# Altium project BACK.PrjPcb
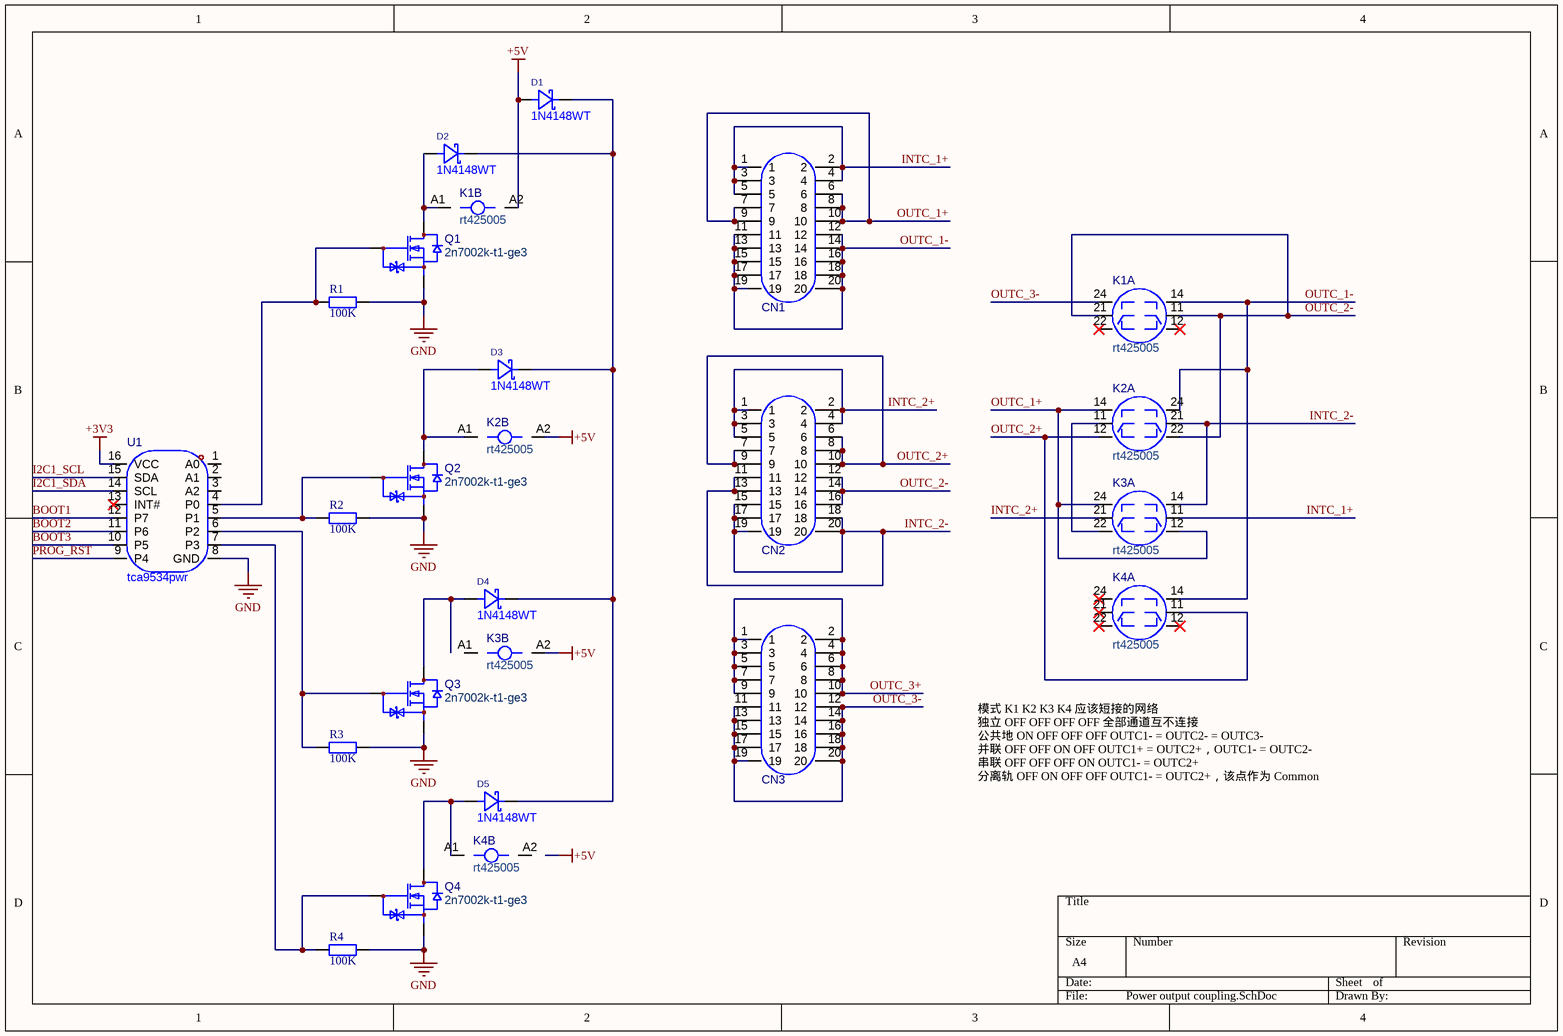
[diagram p0: Power output coupling.SchDoc]
2 sheets, 26 parts. Net scope: global (net labels, ports and power ports of the same name join across sheets).
Sheets:
  Power output coupling.SchDoc
  DIB_connect.SchDoc

## Sheet Power output coupling.SchDoc
size A4; SheetNumber: 1; SheetTotal: 2

### Parts
CN1  sbh11-pbpc-d10-st-bk  [IDC-TH_20P-P2.54-V-R2-C10-S2.54]  (value not drawn)
CN2  sbh11-pbpc-d10-st-bk  [IDC-TH_20P-P2.54-V-R2-C10-S2.54]  (value not drawn)
CN3  sbh11-pbpc-d10-st-bk  [IDC-TH_20P-P2.54-V-R2-C10-S2.54]  (value not drawn)
D1  1N4148WT  [SOD-523_L1.2-W0.8-LS1.6-FD]
D2  1N4148WT  [SOD-523_L1.2-W0.8-LS1.6-FD]
D3  1N4148WT  [SOD-523_L1.2-W0.8-LS1.6-FD]
D4  1N4148WT  [SOD-523_L1.2-W0.8-LS1.6-FD]
D5  1N4148WT  [SOD-523_L1.2-W0.8-LS1.6-FD]
K1  rt425005  [RELAY-TH_TE-CONNECTIVITY_RTX2XXX]  (parts A,B of 2)
K2  rt425005  [RELAY-TH_TE-CONNECTIVITY_RTX2XXX]  (parts A,B of 2)
K3  rt425005  [RELAY-TH_TE-CONNECTIVITY_RTX2XXX]  (parts A,B of 2)
K4  rt425005  [RELAY-TH_TE-CONNECTIVITY_RTX2XXX]  (parts A,B of 2)
Q1  2n7002k-t1-ge3  [SOT-23-3_L2.9-W1.6-P1.90-LS2.8-BR]
Q2  2n7002k-t1-ge3  [SOT-23-3_L2.9-W1.6-P1.90-LS2.8-BR]
Q3  2n7002k-t1-ge3  [SOT-23-3_L2.9-W1.6-P1.90-LS2.8-BR]
Q4  2n7002k-t1-ge3  [SOT-23-3_L2.9-W1.6-P1.90-LS2.8-BR]
R1  100K  [R0603]
R2  100K  [R0603]
R3  100K  [R0603]
R4  100K  [R0603]
U1  tca9534pwr  [TSSOP-16_L5.0-W4.4-P0.65-LS6.4-BL]

### Nets
+3V3: U1.16(VCC)
+5V: D1.1(A) K1.A2 K2.A2 K3.A2
GND: Q1.2(S) Q2.2(S) Q3.2(S) Q4.2(S) R1.2 R2.2 R3.2 R4.2 U1.8(GND)
BOOT1: U1.12(P7)
BOOT2: U1.11(P6)
BOOT3: U1.10(P5)
I2C1_SCL: U1.15(SDA)
I2C1_SDA: U1.14(SCL)
INTC_1+: CN1.1 CN1.2 CN1.3 CN1.4 CN1.5 K3.11
INTC_2+: CN2.1 CN2.2 CN2.3 CN2.4 CN2.5 K3.21
INTC_2-: CN2.11 CN2.13 CN2.15 CN2.17 CN2.18 CN2.19 CN2.20 K2.21 K3.14
OUTC_1+: CN1.6 CN1.7 CN1.8 CN1.9 CN1.10 K2.14 K3.12 K3.24
OUTC_1-: CN1.11 CN1.12 CN1.13 CN1.14 CN1.15 CN1.16 CN1.17 CN1.18 CN1.19 CN1.20 K1.14 K2.24 K4.14
OUTC_2+: CN2.6 CN2.7 CN2.8 CN2.9 CN2.10 K2.12 K4.11
OUTC_2-: CN2.12 CN2.14 CN2.16 K1.11 K1.21 K2.22
OUTC_3+: CN3.1 CN3.2 CN3.3 CN3.4 CN3.5 CN3.6 CN3.7 CN3.8 CN3.9 CN3.10
OUTC_3-: CN3.11 CN3.12 CN3.13 CN3.14 CN3.15 CN3.16 CN3.17 CN3.18 CN3.19 CN3.20 K1.24
PROG_RST: U1.9(P4)
NetD1_2: D1.2(K) D2.2(K) D3.2(K) D4.2(K) D5.2(K)
NetD2_1: D2.1(A) K1.A1 Q1.3(D)
NetD3_1: D3.1(A) K2.A1 Q2.3(D)
NetD4_1: D4.1(A) Q3.3(D)
NetD5_1: D5.1(A) K4.A1 Q4.3(D)
NetK2_11: K2.11 K3.22
NetQ1_1: Q1.1(G) R1.1 U1.4(P0)
NetQ2_1: Q2.1(G) R2.1 U1.5(P1)
NetQ3_1: Q3.1(G) R3.1 U1.6(P2)
NetQ4_1: Q4.1(G) R4.1 U1.7(P3)

Not connected (* = marked no-connect by the designer): K1 12* 22*; K3 A1; K4 12* 21* 22* 24* A2; U1 1(A0) 2(A1) 3(A2) 13(INT#)*

### Notes on the sheet
- 模式	K1	K2	K3	K4	应该短接的网络
  独立	OFF	OFF	OFF	OFF	全部通道互不连接
  公共地	ON	OFF	OFF	OFF	OUTC1- = OUTC2- = OUTC3-
  并联	OFF	OFF	ON	OFF	OUTC1+ = OUTC2+，OUTC1- = OUTC2-
  串联	OFF	OFF	OFF	ON	OUTC1- = OUTC2+
  分离轨	OFF	ON	OFF	OFF	OUTC1- = OUTC2+，该点作为 Common

### Library data of the parts
CN1-CN3 = sbh11-pbpc-d10-st-bk: 插针结构:2x10P;间距:2.54mm;安装方式:直插;总PIN数:20P;排数:2;每排PIN数:10;行距:2.54mm;额定电流:3A;触头材质:黄铜;触头镀层:金;工作温度:-40℃~+105℃;; Manufacturer: Sullins; AddInBom: yes; ModelId: 919cb9b113224b379d0081fecd8b0ef1; ModelTransform: 1299.21,358.267,0,0,0,0,0,5.906,-118.11; Pins Structure: 2x10P; Pitch: 2.54mm; Number of PINs Per Row: 10; Current Rating: 3A; Flame Retardant Rating: UL94V-0; Symbol: SBH11-PBPC-D10-ST-BK; LCSC Part Name: 2x10P 间距:2.54mm 直插; SupplierPart: C17537739; ManufacturerPart: SBH11-PBPC-D10-ST-BK; Supplier Footprint: 插件; JLCPCB Part Class: Extended Part; Datasheet: https://item.szlcsc.com/datasheet/SBH11-PBPC-D10-ST-BK/18666954.html; Supplier: LCSC; ConvertToPcb: yes; FootprintName: IDC-TH_20P-P2.54-V-R2-C10-S2.54; ModelName: IDC-TH_20P-P2.54-V-R2-C10-S2.54; Mounting Type: 直插; Number of Pins: 20P; Number of Rows: 2; Row Spacing: 2.54mm; Contact Material: 黄铜; Contact Plating: 金; Operating Temperature: -40℃~+105℃; Color: 黑色
D1-D5 = 1N4148WT: 二极管配置:独立式;整流电流:150mA;直流反向耐压(Vr):100V;正向压降(Vf):1.25V@150mA;反向恢复时间(Trr):4ns;; Manufacturer: R+O(宏嘉诚); Symbol: 1N4148WT_C7420320; AddInBom: yes; ModelId: 8f56a03db567494d8f4c9d12aa52a741; ModelName: SOD-523_L1.2-W0.8-H0.7-LS1.6; ModelTransform: 62.992,31.496,0,0,0,0,0,0,0; Diode Configuration: 独立式; Pd - Power Dissipation: 150mW; Current - Rectified: 150mA; Voltage - DC Reverse(Vr): 100V; Non-Repetitive Peak Forward Surge Current: 2A; Reverse Leakage Current (Ir): 1uA@75V; Reverse Recovery Time (trr): 4ns; Operating Junction Temperature Range: -55℃~+150℃; LCSC Part Name: 100V 150mA; SupplierPart: C7420320; ManufacturerPart: 1N4148WT; Supplier Footprint: SOD-523; JLCPCB Part Class: Extended Part; Datasheet: https://item.szlcsc.com/datasheet/1N4148WT/8397142.html; Supplier: LCSC; ConvertToPcb: yes; FootprintName: SOD-523_L1.2-W0.8-LS1.6-FD; Voltage - Forward(Vf@If): 1.25V@150mA
K1-K4 = rt425005: 线圈电压:5V;触点形式:两组转换:2C(双刀双掷-转换);触点容量(电阻负载):-;最大切换电压:400V@AC;最大切换电流:8A;; Manufacturer: TE Connectivity(泰科电子); AddInBom: yes; Coil Voltage: 5V; Switching Current(Max): 8A; Operate Time: 8ms; Release Time: 6ms; Symbol: RT425005; LCSC Part Name: 无锁存; SupplierPart: C1562806; ManufacturerPart: RT425005; Supplier Footprint: 插件,12.7x29mm; JLCPCB Part Class: Extended Part; Datasheet: https://atta.szlcsc.com/upload/public/pdf/source/20190115/C355428_EB073CA45DAF06C209EB42DB64E487D3.pdf; Supplier: LCSC; ConvertToPcb: yes; FootprintName: RELAY-TH_TE-CONNECTIVITY_RTX2XXX; Contact Form: 两组转换:2C(双刀双掷-转换); Number of Pins: -; Contact Rating: -; Switching Voltage(Max): 400V@AC; Contact Material: AgNi+镀金; Coil Type: -; Coil Resistance: -; Contact Resistance: -; Operating Temperature: -40℃~+85℃
Q1-Q4 = 2n7002k-t1-ge3: 数量:1个N沟道;漏源电压(Vdss):60V;连续漏极电流(Id):300mA;导通电阻(RDS(on)):2Ω@10V;耗散功率(Pd):350mW;阈值电压(Vgs(th)):2.5V;; Manufacturer: VISHAY(威世); AddInBom: yes; ModelId: 89cb27a44ab2466697082bb9fd73a7d0; ModelName: SOT-23-3L_L2.9-W1.6-H1.1-LS2.8-P0.95; ModelTransform: 114.173,110.236,0,90,0,0,0,0,0; Number: 1个N沟道; Drain to Source Voltage: 60V; Current - Continuous Drain(Id): 300mA; RDS(on): 2Ω@10V; Pd - Power Dissipation: 350mW; Gate Threshold Voltage (Vgs(th)): 2.5V; Gate Charge(Qg): 600pC@10V; Reverse Transfer Capacitance (Crss@Vds): 2.5pF; Symbol: 2N7002K-T1-GE3; LCSC Part Name: 1个N沟道 耐压:60V 电流:300mA; SupplierPart: C81445; ManufacturerPart: 2N7002K-T1-GE3; Supplier Footprint: SOT-23; JLCPCB Part Class: Extended Part; Datasheet: https://item.szlcsc.com/datasheet/2N7002K-T1-GE3/82596.html; Supplier: LCSC; ConvertToPcb: yes; FootprintName: SOT-23-3_L2.9-W1.6-P1.90-LS2.8-BR; Input Capacitance(Ciss): -; Operating Temperature: -55℃~+150℃
R1-R4 = R0603: Resistor; Published: 8-Jun-2000; LatestRevisionDate: 17-Jul-2002; LatestRevisionNote: Re-released for DXP Platform.; Publisher: Altium Limited
U1 = tca9534pwr: 接口类型:I2C;时钟频率(fc):400kHz;; Manufacturer: TI(德州仪器); AddInBom: yes; ModelId: e184b9ae7def452b81228c95a013214c; ModelName: TSSOP-16_L5.0-W4.4-H1.0-LS6.4-P0.65; ModelTransform: 252.188,196.85,0,90,0,0,0,0.005,0; Interface: I2C; Interrupt Output: 有中断输出; Voltage - Supply: 1.65V~5.5V; Clock Frequency: 400kHz; Symbol: TCA9534PWR; LCSC Part Name: 具有中断输出和配置寄存器的低电压8位I²C和SMBUS低功耗I/O扩展器; SupplierPart: C783615; ManufacturerPart: TCA9534PWR; Supplier Footprint: TSSOP-16; JLCPCB Part Class: Extended Part; Datasheet: https://www.ti.com/cn/lit/gpn/tca9534; Supplier: LCSC; ConvertToPcb: yes; FootprintName: TSSOP-16_L5.0-W4.4-P0.65-LS6.4-BL; Output Type: -; Current - Output Low(IOL): -; Current - Output High(IOH): -; Operating Temperature: -40℃~+85℃

## Sheet DIB_connect.SchDoc
size A4; SheetNumber: 2; SheetTotal: 2
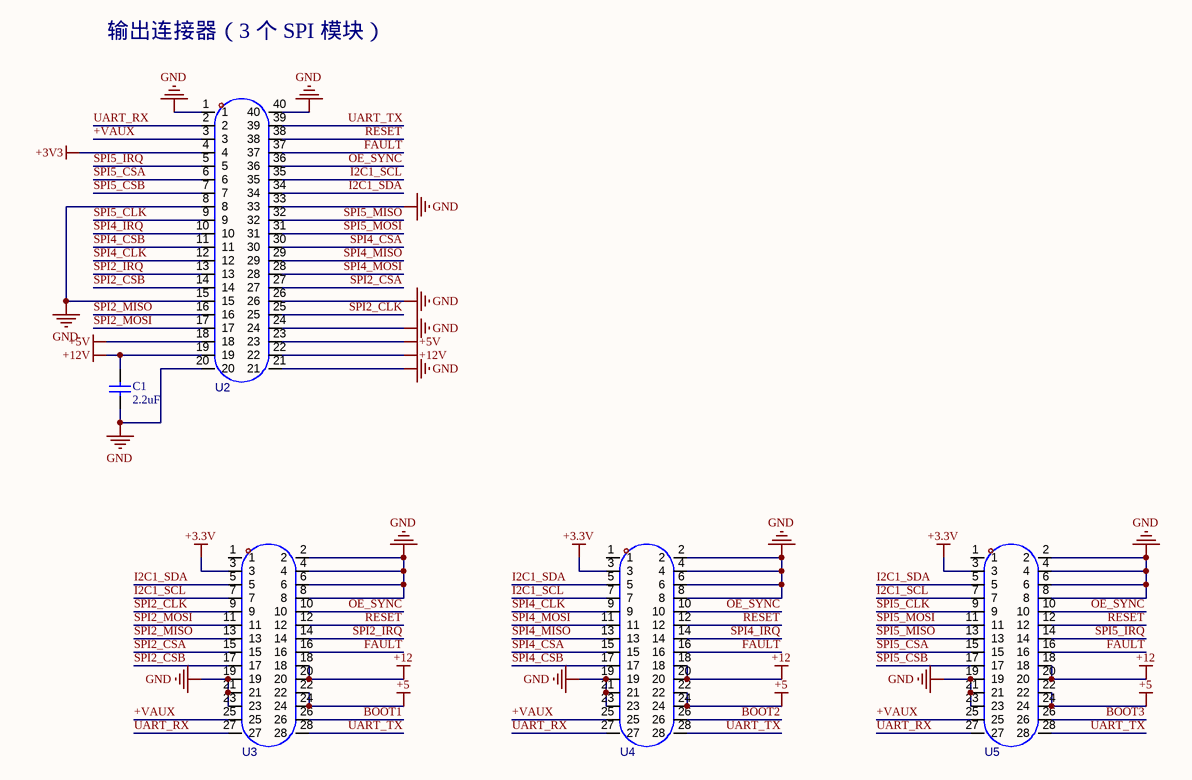
[diagram p1: DIB_connect.SchDoc]

### Parts
C1  2.2uF  [C0603]
U2  ds1024-2x20r2  [HDR-TH_40P-P2.54-H-F-R2-C20-S2.54-W8.5]  (value not drawn)
U3  hc-pm254-8.5h-2x14pz  [HDR-TH_28P-P2.54-V-F-R2-C14-S2.54]  (value not drawn)
U4  hc-pm254-8.5h-2x14pz  [HDR-TH_28P-P2.54-V-F-R2-C14-S2.54]  (value not drawn)
U5  hc-pm254-8.5h-2x14pz  [HDR-TH_28P-P2.54-V-F-R2-C14-S2.54]  (value not drawn)

### Nets
+3.3V: U3.3 U4.3 U5.3
+3V3: U2.4
+5: U3.22 U3.24 U4.22 U4.24 U5.22 U5.24
+5V: U2.18 U2.23
+12: U3.18 U3.20 U4.18 U4.20 U5.18 U5.20
+12V: C1.2 U2.19 U2.22
GND: C1.1 U2.1 U2.8 U2.15 U2.20 U2.21 U2.24 U2.26 U2.33 U2.40 U3.2 U3.4 U3.6 U3.8 U3.19 U3.21 U3.23 U4.2 U4.4 U4.6 U4.8 U4.19 U4.21 U4.23 U5.2 U5.4 U5.6 U5.8 U5.19 U5.21 U5.23
+VAUX: U2.3 U3.25 U4.25 U5.25
BOOT1: U3.26
BOOT2: U4.26
BOOT3: U5.26
FAULT: U2.37 U3.16 U4.16 U5.16
I2C1_SCL: U2.35 U3.7 U4.7 U5.7
I2C1_SDA: U2.34 U3.5 U4.5 U5.5
OE_SYNC: U2.36 U3.10 U4.10 U5.10
RESET: U2.38 U3.12 U4.12 U5.12
SPI2_CLK: U2.25 U3.9
SPI2_CSA: U2.27 U3.15
SPI2_CSB: U2.14 U3.17
SPI2_IRQ: U2.13 U3.14
SPI2_MISO: U2.16 U3.13
SPI2_MOSI: U2.17 U3.11
SPI4_CLK: U2.12 U4.9
SPI4_CSA: U2.30 U4.15
SPI4_CSB: U2.11 U4.17
SPI4_IRQ: U2.10 U4.14
SPI4_MISO: U2.29 U4.13
SPI4_MOSI: U2.28 U4.11
SPI5_CLK: U2.9 U5.9
SPI5_CSA: U2.6 U5.15
SPI5_CSB: U2.7 U5.17
SPI5_IRQ: U2.5 U5.14
SPI5_MISO: U2.32 U5.13
SPI5_MOSI: U2.31 U5.11
UART_RX: U2.2 U3.27 U4.27 U5.27
UART_TX: U2.39 U3.28 U4.28 U5.28

Not connected (* = marked no-connect by the designer): U3 1; U4 1; U5 1

### Notes on the sheet
- 输出连接器（3 个 SPI 模块）

### Library data of the parts
C1 = C0603: Capacitor; Value: 104; Published: 8-Jun-2000; LatestRevisionDate: 17-Jul-2002; LatestRevisionNote: Re-released for DXP Platform.; Publisher: Altium Limited
U2 = ds1024-2x20r2: 插孔结构:2x20P;间距:2.54mm;行距:2.54mm;圆孔/方孔:方孔;安装方式:弯插;排数:双排;总孔位数:40P;额定电流:3A;额定电压:250V;插孔方向:侧面;塑高:2.5mm;触头镀层:金镍;工作温度:-40℃~+105℃;; Manufacturer: CONNFLY; AddInBom: yes; ModelId: a9ccadb72efd4c37a205c7e50d3d2ca6; ModelTransform: 2023.618,499.999,0,180,0,0,0,192.917,-125.984; Holes Structure: 2x20P; Pitch: 2.54mm; Circular Hole / Square Hole: 方孔; Number of Positions: 40P; Current Rating: 3A; Voltage Rating (Max): 250V; Holes Direction: 侧面; Symbol: DS1024-2X20R2; LCSC Part Name: 黑色 2x20P 间距:2.54mm 弯插; SupplierPart: C7509545; ManufacturerPart: DS1024-2x20R2; Supplier Footprint: 弯插,P=2.54mm; JLCPCB Part Class: Extended Part; Datasheet: https://item.szlcsc.com/datasheet/DS1024-2x20R2/8601981.html; Supplier: LCSC; ConvertToPcb: yes; FootprintName: HDR-TH_40P-P2.54-H-F-R2-C20-S2.54-W8.5; ModelName: HDR-TH_40P-P2.54-H-F-R2-C20-S2.54-W8.5; Row Spacing: 2.54mm; Mounting Type: 弯插; Number of Rows: 双排; Insulation Height: 2.5mm; Contact Plating: 金镍; Operating Temperature: -40℃~+105℃
U3-U5 = hc-pm254-8.5h-2x14pz: 插孔结构:2x14P;间距:2.54mm;行距:2.54mm;圆孔/方孔:方孔;安装方式:直插;排数:双排;总孔位数:28P;额定电流:3A;额定电压:-;插孔方向:顶部;塑高:8.5mm;触头材质:黄铜;触头镀层:金;工作温度:-40℃~+105℃;; Manufacturer: HC(虹成电子); AddInBom: yes; ModelId: 7a003188d48b46d1b4dfaea3b006a9b7; ModelName: HDR-TH_28P-P2.54-F-LI-2X14P; ModelTransform: 1419.682,196.85,0,0,0,0,0,0,-118.11; Holes Structure: 2x14P; Pitch: 2.54mm; Circular Hole / Square Hole: 方孔; Number of Positions: 28P; Current Rating: 3A; Holes Direction: 顶部; PIN Length: 3mm; Symbol: HC-PM254-8.5H-2X14PZ; LCSC Part Name: 间距2.54mm 2x14Pin 直插 PC3.0 H8.5; SupplierPart: C22373919; ManufacturerPart: HC-PM254-8.5H-2x14PZ; Supplier Footprint: 插件,P=2.54mm; JLCPCB Part Class: Extended Part; Datasheet: https://item.szlcsc.com/datasheet/HC-PM254-8.5H-2x14PZ/23870255.html; Supplier: LCSC; ConvertToPcb: yes; FootprintName: HDR-TH_28P-P2.54-V-F-R2-C14-S2.54; Row Spacing: 2.54mm; Mounting Type: 直插; Number of Rows: 双排; Voltage Rating (Max): -; Insulation Height: 8.5mm; Contact Material: 黄铜; Contact Plating: 金; Operating Temperature: -40℃~+105℃; Supplementary Features: -

## Nets that join several sheets
+3V3: Power output coupling (U1.16), DIB_connect (U2.4)
+5V: Power output coupling (D1.1 K1.A2 K2.A2 K3.A2), DIB_connect (U2.18 U2.23)
GND: Power output coupling (9 pins), DIB_connect (31 pins)
BOOT1: Power output coupling (U1.12), DIB_connect (U3.26)
BOOT2: Power output coupling (U1.11), DIB_connect (U4.26)
BOOT3: Power output coupling (U1.10), DIB_connect (U5.26)
I2C1_SCL: Power output coupling (U1.15), DIB_connect (U2.35 U3.7 U4.7 U5.7)
I2C1_SDA: Power output coupling (U1.14), DIB_connect (U2.34 U3.5 U4.5 U5.5)